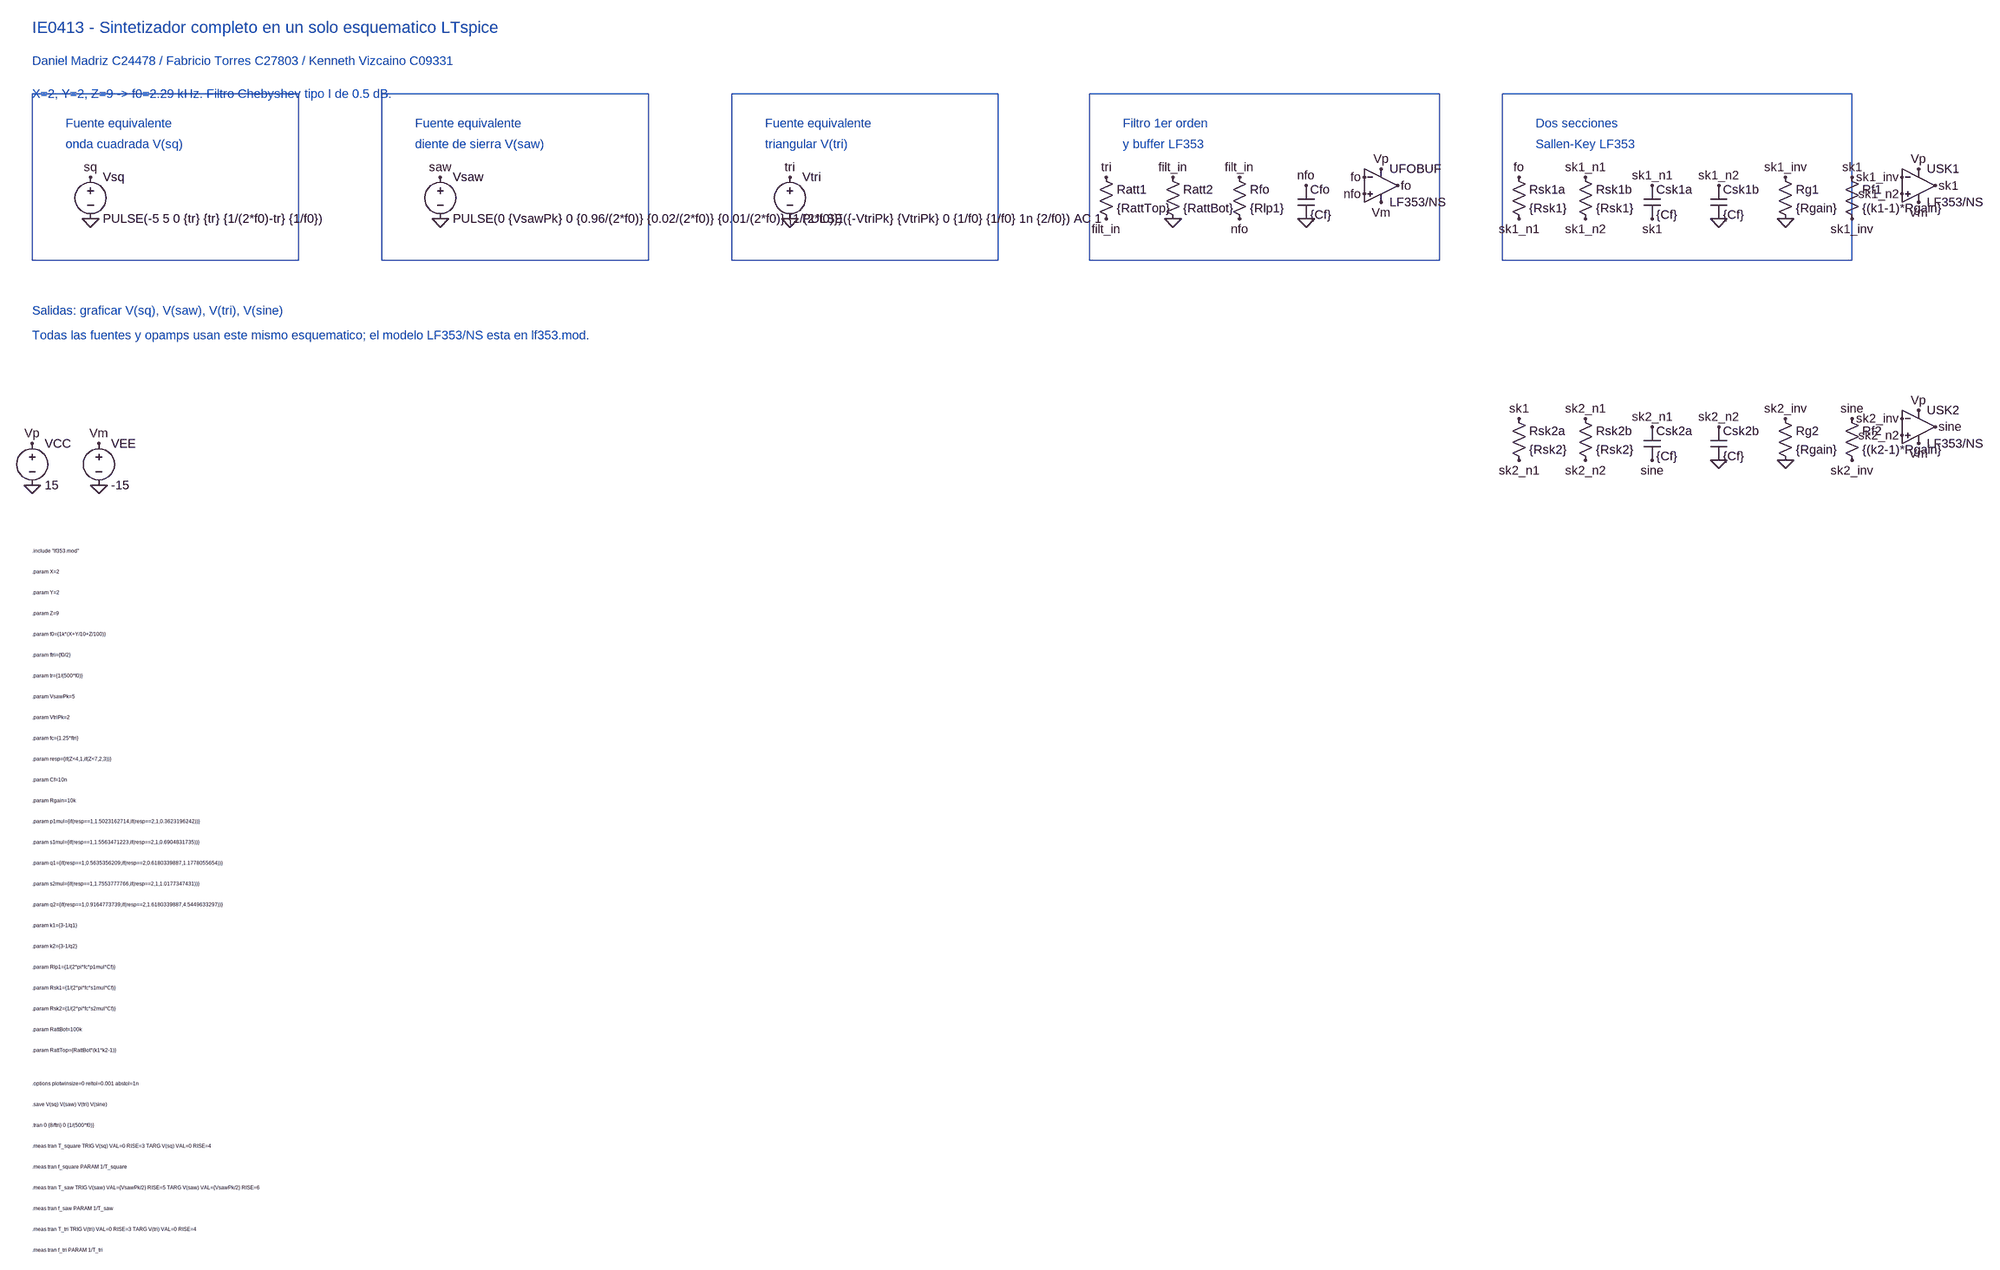
[diagram p0: schematic sintetizador_completo_LF353.asc]
sintetizador_completo_LF353.asc, the LTspice schematic file:
Version 4
SHEET 1 3200 2200
RECTANGLE Normal -1392 -1040 -1904 -1360
RECTANGLE Normal -720 -1040 -1232 -1360
RECTANGLE Normal -48 -1040 -560 -1360
RECTANGLE Normal 800 -1040 128 -1360
RECTANGLE Normal 1648 -1040 976 -1360
TEXT -1904 -1488 Left 3 ;IE0413 - Sintetizador completo en un solo esquematico LTspice
TEXT -1904 -1424 Left 2 ;Daniel Madriz C24478 / Fabricio Torres C27803 / Kenneth Vizcaino C09331
TEXT -1904 -1360 Left 2 ;X=2, Y=2, Z=9 -> f0=2.29 kHz. Filtro Chebyshev tipo I de 0.5 dB.
TEXT -1840 -1304 Left 2 ;Fuente equivalente
TEXT -1840 -1264 Left 2 ;onda cuadrada V(sq)
TEXT -1168 -1304 Left 2 ;Fuente equivalente
TEXT -1168 -1264 Left 2 ;diente de sierra V(saw)
TEXT -496 -1304 Left 2 ;Fuente equivalente
TEXT -496 -1264 Left 2 ;triangular V(tri)
TEXT 192 -1304 Left 2 ;Filtro 1er orden
TEXT 192 -1264 Left 2 ;y buffer LF353
TEXT 1040 -1304 Left 2 ;Dos secciones
TEXT 1040 -1264 Left 2 ;Sallen-Key LF353
TEXT -1904 -944 Left 2 ;Salidas: graficar V(sq), V(saw), V(tri), V(sine)
TEXT -1904 -896 Left 2 ;Todas las fuentes y opamps usan este mismo esquematico; el modelo LF353/NS esta en lf353.mod.
SYMBOL voltage -1792 -1216 R0
SYMATTR InstName Vsq
SYMATTR Value PULSE(-5 5 0 {tr} {tr} {1/(2*f0)-tr} {1/f0})
FLAG -1792 -1200 sq
FLAG -1792 -1120 0
SYMBOL voltage -1120 -1216 R0
SYMATTR InstName Vsaw
SYMATTR Value PULSE(0 {VsawPk} 0 {0.96/(2*f0)} {0.02/(2*f0)} {0.01/(2*f0)} {1/(2*f0)})
FLAG -1120 -1200 saw
FLAG -1120 -1120 0
SYMBOL voltage -448 -1216 R0
SYMATTR InstName Vtri
SYMATTR Value PULSE({-VtriPk} {VtriPk} 0 {1/f0} {1/f0} 1n {2/f0}) AC 1
FLAG -448 -1200 tri
FLAG -448 -1120 0
SYMBOL voltage -1904 -704 R0
SYMATTR InstName VCC
SYMATTR Value 15
FLAG -1904 -688 Vp
FLAG -1904 -608 0
SYMBOL voltage -1776 -704 R0
SYMATTR InstName VEE
SYMATTR Value -15
FLAG -1776 -688 Vm
FLAG -1776 -608 0
SYMBOL res 144 -1216 R0
SYMATTR InstName Ratt1
SYMATTR Value {RattTop}
FLAG 160 -1200 tri
FLAG 160 -1120 filt_in
SYMBOL res 272 -1216 R0
SYMATTR InstName Ratt2
SYMATTR Value {RattBot}
FLAG 288 -1200 filt_in
FLAG 288 -1120 0
SYMBOL res 400 -1216 R0
SYMATTR InstName Rfo
SYMATTR Value {Rlp1}
FLAG 416 -1200 filt_in
FLAG 416 -1120 nfo
SYMBOL cap 528 -1184 R0
SYMATTR InstName Cfo
SYMATTR Value {Cf}
FLAG 544 -1184 nfo
FLAG 544 -1120 0
SYMBOL Opamps\\opamp2 688 -1248 R0
SYMATTR InstName UFOBUF
SYMATTR Value LF353/NS
FLAG 656 -1168 nfo
FLAG 656 -1200 fo
FLAG 720 -1184 fo
FLAG 688 -1216 Vp
FLAG 688 -1152 Vm
SYMBOL res 992 -1216 R0
SYMATTR InstName Rsk1a
SYMATTR Value {Rsk1}
FLAG 1008 -1200 fo
FLAG 1008 -1120 sk1_n1
SYMBOL res 1120 -1216 R0
SYMATTR InstName Rsk1b
SYMATTR Value {Rsk1}
FLAG 1136 -1200 sk1_n1
FLAG 1136 -1120 sk1_n2
SYMBOL cap 1248 -1184 R0
SYMATTR InstName Csk1a
SYMATTR Value {Cf}
FLAG 1264 -1184 sk1_n1
FLAG 1264 -1120 sk1
SYMBOL cap 1376 -1184 R0
SYMATTR InstName Csk1b
SYMATTR Value {Cf}
FLAG 1392 -1184 sk1_n2
FLAG 1392 -1120 0
SYMBOL res 1504 -1216 R0
SYMATTR InstName Rg1
SYMATTR Value {Rgain}
FLAG 1520 -1200 sk1_inv
FLAG 1520 -1120 0
SYMBOL res 1632 -1216 R0
SYMATTR InstName Rf1
SYMATTR Value {(k1-1)*Rgain}
FLAG 1648 -1200 sk1
FLAG 1648 -1120 sk1_inv
SYMBOL Opamps\\opamp2 1776 -1248 R0
SYMATTR InstName USK1
SYMATTR Value LF353/NS
FLAG 1744 -1168 sk1_n2
FLAG 1744 -1200 sk1_inv
FLAG 1808 -1184 sk1
FLAG 1776 -1216 Vp
FLAG 1776 -1152 Vm
SYMBOL res 992 -752 R0
SYMATTR InstName Rsk2a
SYMATTR Value {Rsk2}
FLAG 1008 -736 sk1
FLAG 1008 -656 sk2_n1
SYMBOL res 1120 -752 R0
SYMATTR InstName Rsk2b
SYMATTR Value {Rsk2}
FLAG 1136 -736 sk2_n1
FLAG 1136 -656 sk2_n2
SYMBOL cap 1248 -720 R0
SYMATTR InstName Csk2a
SYMATTR Value {Cf}
FLAG 1264 -720 sk2_n1
FLAG 1264 -656 sine
SYMBOL cap 1376 -720 R0
SYMATTR InstName Csk2b
SYMATTR Value {Cf}
FLAG 1392 -720 sk2_n2
FLAG 1392 -656 0
SYMBOL res 1504 -752 R0
SYMATTR InstName Rg2
SYMATTR Value {Rgain}
FLAG 1520 -736 sk2_inv
FLAG 1520 -656 0
SYMBOL res 1632 -752 R0
SYMATTR InstName Rf2
SYMATTR Value {(k2-1)*Rgain}
FLAG 1648 -736 sine
FLAG 1648 -656 sk2_inv
SYMBOL Opamps\\opamp2 1776 -784 R0
SYMATTR InstName USK2
SYMATTR Value LF353/NS
FLAG 1744 -704 sk2_n2
FLAG 1744 -736 sk2_inv
FLAG 1808 -720 sine
FLAG 1776 -752 Vp
FLAG 1776 -688 Vm
TEXT -1904 -448 Left 0 !.include "lf353.mod"
TEXT -1904 -408 Left 0 !.param X=2
TEXT -1904 -368 Left 0 !.param Y=2
TEXT -1904 -328 Left 0 !.param Z=9
TEXT -1904 -288 Left 0 !.param f0={1k*(X+Y/10+Z/100)}
TEXT -1904 -248 Left 0 !.param ftri={f0/2}
TEXT -1904 -208 Left 0 !.param tr={1/(500*f0)}
TEXT -1904 -168 Left 0 !.param VsawPk=5
TEXT -1904 -128 Left 0 !.param VtriPk=2
TEXT -1904 -88 Left 0 !.param fc={1.25*ftri}
TEXT -1904 -48 Left 0 !.param resp={if(Z<4,1,if(Z<7,2,3))}
TEXT -1904 -8 Left 0 !.param Cf=10n
TEXT -1904 32 Left 0 !.param Rgain=10k
TEXT -1904 72 Left 0 !.param p1mul={if(resp==1,1.5023162714,if(resp==2,1,0.3623196242))}
TEXT -1904 112 Left 0 !.param s1mul={if(resp==1,1.5563471223,if(resp==2,1,0.6904831735))}
TEXT -1904 152 Left 0 !.param q1={if(resp==1,0.5635356209,if(resp==2,0.6180339887,1.1778055654))}
TEXT -1904 192 Left 0 !.param s2mul={if(resp==1,1.7553777766,if(resp==2,1,1.0177347431))}
TEXT -1904 232 Left 0 !.param q2={if(resp==1,0.9164773739,if(resp==2,1.6180339887,4.5449633297))}
TEXT -1904 272 Left 0 !.param k1={3-1/q1}
TEXT -1904 312 Left 0 !.param k2={3-1/q2}
TEXT -1904 352 Left 0 !.param Rlp1={1/(2*pi*fc*p1mul*Cf)}
TEXT -1904 392 Left 0 !.param Rsk1={1/(2*pi*fc*s1mul*Cf)}
TEXT -1904 432 Left 0 !.param Rsk2={1/(2*pi*fc*s2mul*Cf)}
TEXT -1904 472 Left 0 !.param RattBot=100k
TEXT -1904 512 Left 0 !.param RattTop={RattBot*(k1*k2-1)}
TEXT -1904 576 Left 0 !.options plotwinsize=0 reltol=0.001 abstol=1n
TEXT -1904 616 Left 0 !.save V(sq) V(saw) V(tri) V(sine)
TEXT -1904 656 Left 0 !.tran 0 {8/ftri} 0 {1/(500*f0)}
TEXT -1904 696 Left 0 !.meas tran T_square TRIG V(sq) VAL=0 RISE=3 TARG V(sq) VAL=0 RISE=4
TEXT -1904 736 Left 0 !.meas tran f_square PARAM 1/T_square
TEXT -1904 776 Left 0 !.meas tran T_saw TRIG V(saw) VAL={VsawPk/2} RISE=5 TARG V(saw) VAL={VsawPk/2} RISE=6
TEXT -1904 816 Left 0 !.meas tran f_saw PARAM 1/T_saw
TEXT -1904 856 Left 0 !.meas tran T_tri TRIG V(tri) VAL=0 RISE=3 TARG V(tri) VAL=0 RISE=4
TEXT -1904 896 Left 0 !.meas tran f_tri PARAM 1/T_tri

The netlist it stands for:
* sintetizador_completo_LF353.asc
Vsq sq 0 PULSE(-5 5 0 {tr} {tr} {1/(2*f0)-tr} {1/f0})
Vsaw saw 0 PULSE(0 {VsawPk} 0 {0.96/(2*f0)} {0.02/(2*f0)} {0.01/(2*f0)} {1/(2*f0)})
Vtri tri 0 PULSE({-VtriPk} {VtriPk} 0 {1/f0} {1/f0} 1n {2/f0}) AC 1
VCC Vp 0 15
VEE Vm 0 -15
Ratt1 tri filt_in {RattTop}
Ratt2 filt_in 0 {RattBot}
Rfo filt_in nfo {Rlp1}
Cfo nfo 0 {Cf}
XUFOBUF nfo fo Vp Vm fo LF353/NS  ; pins In+ In- V+ V- OUT
Rsk1a fo sk1_n1 {Rsk1}
Rsk1b sk1_n1 sk1_n2 {Rsk1}
Csk1a sk1_n1 sk1 {Cf}
Csk1b sk1_n2 0 {Cf}
Rg1 sk1_inv 0 {Rgain}
Rf1 sk1 sk1_inv {(k1-1)*Rgain}
XUSK1 sk1_n2 sk1_inv Vp Vm sk1 LF353/NS  ; pins In+ In- V+ V- OUT
Rsk2a sk1 sk2_n1 {Rsk2}
Rsk2b sk2_n1 sk2_n2 {Rsk2}
Csk2a sk2_n1 sine {Cf}
Csk2b sk2_n2 0 {Cf}
Rg2 sk2_inv 0 {Rgain}
Rf2 sine sk2_inv {(k2-1)*Rgain}
XUSK2 sk2_n2 sk2_inv Vp Vm sine LF353/NS  ; pins In+ In- V+ V- OUT
* IE0413 - Sintetizador completo en un solo esquematico LTspice
* Daniel Madriz C24478 / Fabricio Torres C27803 / Kenneth Vizcaino C09331
* X=2, Y=2, Z=9 -> f0=2.29 kHz. Filtro Chebyshev tipo I de 0.5 dB.
* Fuente equivalente
* onda cuadrada V(sq)
* Fuente equivalente
* diente de sierra V(saw)
* Fuente equivalente
* triangular V(tri)
* Filtro 1er orden
* y buffer LF353
* Dos secciones
* Sallen-Key LF353
* Salidas: graficar V(sq), V(saw), V(tri), V(sine)
* Todas las fuentes y opamps usan este mismo esquematico; el modelo LF353/NS esta en lf353.mod.
.include "lf353.mod"
.param X=2
.param Y=2
.param Z=9
.param f0={1k*(X+Y/10+Z/100)}
.param ftri={f0/2}
.param tr={1/(500*f0)}
.param VsawPk=5
.param VtriPk=2
.param fc={1.25*ftri}
.param resp={if(Z<4,1,if(Z<7,2,3))}
.param Cf=10n
.param Rgain=10k
.param p1mul={if(resp==1,1.5023162714,if(resp==2,1,0.3623196242))}
.param s1mul={if(resp==1,1.5563471223,if(resp==2,1,0.6904831735))}
.param q1={if(resp==1,0.5635356209,if(resp==2,0.6180339887,1.1778055654))}
.param s2mul={if(resp==1,1.7553777766,if(resp==2,1,1.0177347431))}
.param q2={if(resp==1,0.9164773739,if(resp==2,1.6180339887,4.5449633297))}
.param k1={3-1/q1}
.param k2={3-1/q2}
.param Rlp1={1/(2*pi*fc*p1mul*Cf)}
.param Rsk1={1/(2*pi*fc*s1mul*Cf)}
.param Rsk2={1/(2*pi*fc*s2mul*Cf)}
.param RattBot=100k
.param RattTop={RattBot*(k1*k2-1)}
.options plotwinsize=0 reltol=0.001 abstol=1n
.save V(sq) V(saw) V(tri) V(sine)
.tran 0 {8/ftri} 0 {1/(500*f0)}
.meas tran T_square TRIG V(sq) VAL=0 RISE=3 TARG V(sq) VAL=0 RISE=4
.meas tran f_square PARAM 1/T_square
.meas tran T_saw TRIG V(saw) VAL={VsawPk/2} RISE=5 TARG V(saw) VAL={VsawPk/2} RISE=6
.meas tran f_saw PARAM 1/T_saw
.meas tran T_tri TRIG V(tri) VAL=0 RISE=3 TARG V(tri) VAL=0 RISE=4
.meas tran f_tri PARAM 1/T_tri
.backanno
.end